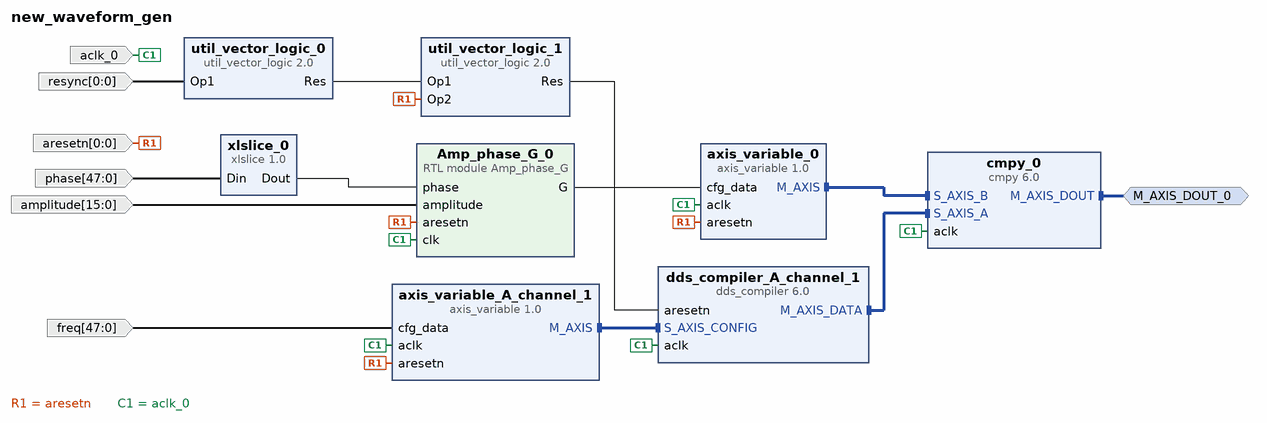
[diagram p0: block diagram of the top level]
# Vivado block design new_waveform_gen, xc7z010clg400-1, Vivado 2021.2
create_bd_design new_waveform_gen

create_bd_intf_port -mode Master -vlnv xilinx.com:interface:axis_rtl:1.0 M_AXIS_DOUT_0
set_property -dict {CONFIG.FREQ_HZ 125000000} [get_bd_intf_ports M_AXIS_DOUT_0]
create_bd_port -dir I -type clk aclk_0
set_property -dict {CONFIG.FREQ_HZ 125000000} [get_bd_ports aclk_0]
create_bd_port -dir I -from 0 -to 0 resync
create_bd_port -dir I -from 0 -to 0 aresetn
create_bd_port -dir I -from 47 -to 0 freq
create_bd_port -dir I -from 47 -to 0 phase
create_bd_port -dir I -from 15 -to 0 amplitude

create_bd_cell -type ip -vlnv pavel-demin:user:axis_variable:1.0 axis_variable_A_channel_1
set_property -dict {CONFIG.AXIS_TDATA_WIDTH 48} [get_bd_cells axis_variable_A_channel_1]
create_bd_cell -type ip -vlnv xilinx.com:ip:dds_compiler:6.0 dds_compiler_A_channel_1
set_property -dict [list \
  CONFIG.Amplitude_Mode Unit_Circle \
  CONFIG.DATA_Has_TLAST Not_Required \
  CONFIG.DDS_Clock_Rate 125 \
  CONFIG.DSP48_Use Minimal \
  CONFIG.Frequency_Resolution 4.440893e-7 \
  CONFIG.Has_ACLKEN false \
  CONFIG.Has_ARESETn true \
  CONFIG.Has_Phase_Out true \
  CONFIG.Has_TREADY false \
  CONFIG.Latency 9 \
  CONFIG.Latency_Configuration Auto \
  CONFIG.M_DATA_Has_TUSER Not_Required \
  CONFIG.M_PHASE_Has_TUSER Not_Required \
  CONFIG.Memory_Type Block_ROM \
  CONFIG.Noise_Shaping Auto \
  CONFIG.Optimization_Goal Auto \
  CONFIG.Output_Frequency1 0 \
  CONFIG.Output_Selection Sine_and_Cosine \
  CONFIG.Output_Width 16 \
  CONFIG.PINC1 0 \
  CONFIG.POFF1 0 \
  CONFIG.Parameter_Entry System_Parameters \
  CONFIG.PartsPresent Phase_Generator_and_SIN_COS_LUT \
  CONFIG.Phase_Increment Programmable \
  CONFIG.Phase_Offset_Angles1 0 \
  CONFIG.Phase_Width 48 \
  CONFIG.Phase_offset Fixed \
  CONFIG.Resync false \
  CONFIG.S_PHASE_Has_TUSER Not_Required \
  CONFIG.Spurious_Free_Dynamic_Range 96 \
] [get_bd_cells dds_compiler_A_channel_1]
create_bd_cell -type ip -vlnv xilinx.com:ip:util_vector_logic:2.0 util_vector_logic_0
set_property -dict {CONFIG.C_OPERATION not CONFIG.C_SIZE 1} [get_bd_cells util_vector_logic_0]
create_bd_cell -type ip -vlnv xilinx.com:ip:util_vector_logic:2.0 util_vector_logic_1
set_property -dict {CONFIG.C_SIZE 1} [get_bd_cells util_vector_logic_1]
create_bd_cell -type ip -vlnv xilinx.com:ip:cmpy:6.0 cmpy_0
set_property -dict [list \
  CONFIG.APortWidth 16 \
  CONFIG.BPortWidth 16 \
  CONFIG.LatencyConfig Manual \
  CONFIG.MinimumLatency 13 \
  CONFIG.OutputWidth 8 \
  CONFIG.RoundMode Truncate \
] [get_bd_cells cmpy_0]
create_bd_cell -type ip -vlnv xilinx.com:ip:xlslice:1.0 xlslice_0
set_property -dict {CONFIG.DIN_FROM 47 CONFIG.DIN_TO 32 CONFIG.DIN_WIDTH 48 CONFIG.DOUT_WIDTH 16} [get_bd_cells xlslice_0]
create_bd_cell -type ip -vlnv pavel-demin:user:axis_variable:1.0 axis_variable_0
create_bd_cell -type module -reference Amp_phase_G Amp_phase_G_0

# ---- connections ----

connect_bd_intf_net [get_bd_intf_pins axis_variable_0/M_AXIS] [get_bd_intf_pins cmpy_0/S_AXIS_B]
connect_bd_intf_net [get_bd_intf_pins axis_variable_A_channel_1/M_AXIS] [get_bd_intf_pins dds_compiler_A_channel_1/S_AXIS_CONFIG]
connect_bd_intf_net [get_bd_intf_ports M_AXIS_DOUT_0] [get_bd_intf_pins cmpy_0/M_AXIS_DOUT]
connect_bd_intf_net [get_bd_intf_pins dds_compiler_A_channel_1/M_AXIS_DATA] [get_bd_intf_pins cmpy_0/S_AXIS_A]
connect_bd_net [get_bd_pins Amp_phase_G_0/G] [get_bd_pins axis_variable_0/cfg_data]
connect_bd_net -net Op1_0_1 [get_bd_ports resync] [get_bd_pins util_vector_logic_0/Op1]
connect_bd_net -net Op2_0_1 [get_bd_ports aresetn] \
  [get_bd_pins util_vector_logic_1/Op2] [get_bd_pins axis_variable_A_channel_1/aresetn] [get_bd_pins axis_variable_0/aresetn] \
  [get_bd_pins Amp_phase_G_0/aresetn]
connect_bd_net -net aclk_0_1 [get_bd_ports aclk_0] \
  [get_bd_pins axis_variable_A_channel_1/aclk] [get_bd_pins dds_compiler_A_channel_1/aclk] [get_bd_pins cmpy_0/aclk] \
  [get_bd_pins axis_variable_0/aclk] [get_bd_pins Amp_phase_G_0/clk]
connect_bd_net [get_bd_ports amplitude] [get_bd_pins Amp_phase_G_0/amplitude]
connect_bd_net [get_bd_ports freq] [get_bd_pins axis_variable_A_channel_1/cfg_data]
connect_bd_net [get_bd_ports phase] [get_bd_pins xlslice_0/Din]
connect_bd_net [get_bd_pins util_vector_logic_0/Res] [get_bd_pins util_vector_logic_1/Op1]
connect_bd_net [get_bd_pins util_vector_logic_1/Res] [get_bd_pins dds_compiler_A_channel_1/aresetn]
connect_bd_net [get_bd_pins xlslice_0/Dout] [get_bd_pins Amp_phase_G_0/phase]

validate_bd_design
save_bd_design
